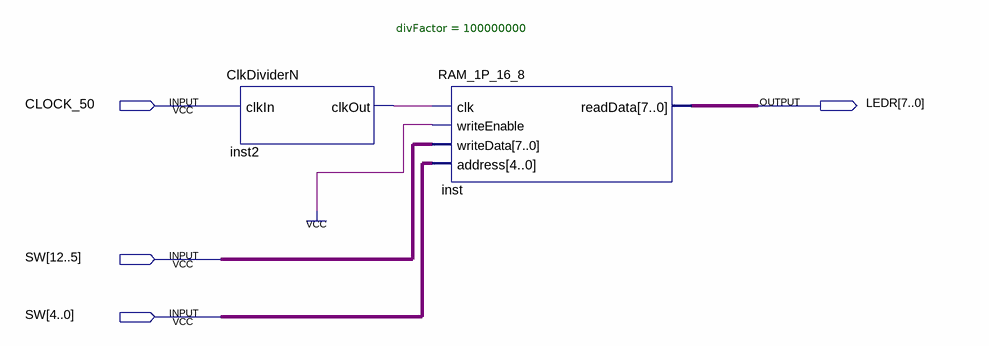
[diagram p0: schematic sheet]
// Quartus schematic RAM_1P_Demo.bdf as structural Verilog: 2 symbols, 4 pins
module RAM_1P_Demo (
  input  CLOCK_50,
  input  [12:0] SW,
  output [7:0] LEDR
);

  wire inst2_clkout;

  ClkDividerN #(.divFactor(100000000)) inst2 (.clkIn(CLOCK_50), .clkOut(inst2_clkout));
  RAM_1P_16_8 inst (.clk(inst2_clkout), .writeEnable(1'b1), .writeData(SW[12:5]), .address(SW[4:0]), .readData(LEDR));
endmodule
